# Altium schematic sheet MAIN.SchDoc
size A; SheetNumber: 1; SheetTotal: 2
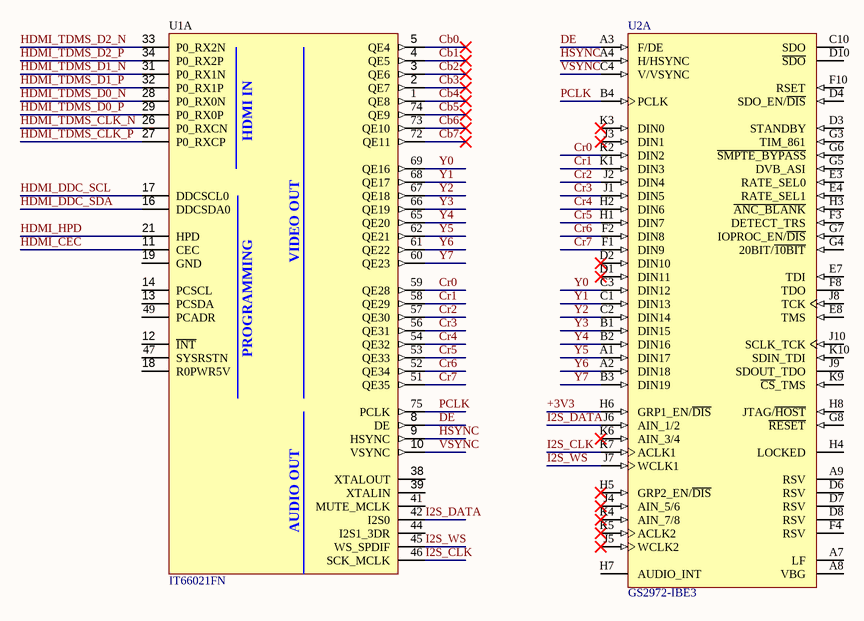
[diagram p0: MAIN.SchDoc]

## Parts
U1  IT66021FN  [QFN40P900X900X90_HS-77N]  (part A of 2)
U2  GS2972-IBE3  [SEMT-BGA-100]  (part A of 2)

## Nets
+3V3: U2.H6(GRP1_EN/~{DIS})
Cb0: U1.5(QE4)
Cb1: U1.4(QE5)
Cb2: U1.3(QE6)
Cb3: U1.2(QE7)
Cb4: U1.1(QE8)
Cb5: U1.74(QE9)
Cb6: U1.73(QE10)
Cb7: U1.72(QE11)
Cr0: U1.59(QE28) U2.K2(DIN2)
Cr1: U1.58(QE29) U2.K1(DIN3)
Cr2: U1.57(QE30) U2.J2(DIN4)
Cr3: U1.56(QE31) U2.J1(DIN5)
Cr4: U1.54(QE32) U2.H2(DIN6)
Cr5: U1.53(QE33) U2.H1(DIN7)
Cr6: U1.52(QE34) U2.F2(DIN8)
Cr7: U1.51(QE35) U2.F1(DIN9)
DE: U1.8(DE) U2.A3(F/DE)
HDMI_CEC: U1.11(CEC)
HDMI_DDC_SCL: U1.17(DDCSCL0)
HDMI_DDC_SDA: U1.16(DDCSDA0)
HDMI_HPD: U1.21(HPD)
HDMI_TDMS_CLK_N: U1.26(P0_RXCN)
HDMI_TDMS_CLK_P: U1.27(P0_RXCP)
HDMI_TDMS_D0_N: U1.28(P0_RX0N)
HDMI_TDMS_D0_P: U1.29(P0_RX0P)
HDMI_TDMS_D1_N: U1.31(P0_RX1N)
HDMI_TDMS_D1_P: U1.32(P0_RX1P)
HDMI_TDMS_D2_N: U1.33(P0_RX2N)
HDMI_TDMS_D2_P: U1.34(P0_RX2P)
HSYNC: U1.9(HSYNC) U2.A4(H/HSYNC)
I2S_CLK: U1.46(SCK_MCLK) U2.K7(ACLK1)
I2S_DATA: U1.42(I2S0) U2.J6(AIN_1/2)
I2S_WS: U1.45(WS_SPDIF) U2.J7(WCLK1)
PCLK: U1.75(PCLK) U2.B4(PCLK)
VSYNC: U1.10(VSYNC) U2.C4(V/VSYNC)
Y0: U1.69(QE16) U2.C3(DIN12)
Y1: U1.68(QE17) U2.C1(DIN13)
Y2: U1.67(QE18) U2.C2(DIN14)
Y3: U1.66(QE19) U2.B1(DIN15)
Y4: U1.65(QE20) U2.B2(DIN16)
Y5: U1.62(QE21) U2.A1(DIN17)
Y6: U1.61(QE22) U2.A2(DIN18)
Y7: U1.60(QE23) U2.B3(DIN19)

Not connected (* = marked no-connect by the designer): U1 12(~{INT}) 13(PCSDA) 14(PCSCL) 18(R0PWR5V) 19(GND) 38(XTALOUT) 39(XTALIN) 41(MUTE_MCLK) 44(I2S1_3DR) 47(SYSRSTN) 49(PCADR); U2 A7(LF) A8(VBG) A9(RSV) C10(SDO) D1(DIN11)* D2(DIN10)* D3(STANDBY) D4(SDO_EN/~{DIS}) D6(RSV) D7(RSV) D8(RSV) D10(~{SDO}) E3(RATE_SEL0) E4(RATE_SEL1) E7(TDI) E8(TMS) F3(DETECT_TRS) F4(RSV) F8(TDO) F10(RSET) G3(TIM_861) G4(20BIT/~{10BIT}) G5(DVB_ASI) G6(~{SMPTE_BYPASS}) G7(IOPROC_EN/~{DIS}) G8(~{RESET}) H3(~{ANC_BLANK}) H4(LOCKED) H5(GRP2_EN/~{DIS})* H7(AUDIO_INT) H8(JTAG/~{HOST}) J3(DIN1)* J4(AIN_5/6)* J5(WCLK2)* J8(TCK) J9(SDOUT_TDO) J10(SCLK_TCK) K3(DIN0)* K4(AIN_7/8)* K5(ACLK2)* K6(AIN_3/4)* K9(~{CS}_TMS) K10(SDIN_TDI)

## Notes on the sheet
- (in symbol IT66021FN, part A) HDMI IN; VIDEO OUT; PROGRAMMING; AUDIO OUT

## Library data of the parts
U1 = IT66021FN: Single-port HDMI1.4 Receiver with 3D Support
U2 = CMP-2000-06375-1: 3G/HD/SD-SDI Serializer with Complete SMPTE Audio & Video Support, 1.2 V, -20 to 85 degC, 100-Pin BGA, RoHS, Tray; Manufacturer: SemtechCorporation; Category: IntegratedCircuits(ICs); Packaging: Tray; Package Description: 100-Ball Ball Grid Array, Body 11 x11 mm, Pitch 1.00 mm; Datasheet Version: Rev. 9, 09/2013; Applications: Video; Mounting Technology: SurfaceMount; Datasheet URL: http://datasheet.octopart.com/GS2972-IBE3-Semtech-datasheet-25020507.pdf; Family: Linear-VideoProcessing; Manufacturer URL: http://www.semtech.com/; Supplier Device Package: 100-BGA(11x11); Mounting Type: SurfaceMount; Package Reference: BGA-100; Package / Case: 100-LBGA; Type: Transmitter; Series: -